# EasyEDA Pro project 电磁车系统板兼作业.eprj

# Schematic Schematic1
Create Date: 2024-03-16; Page Name: P1; Project Name: 电磁车系统板兼作业; Schematic Name: Schematic1; Update Date: 2024-04-13; Company: 嘉立创EDA; Page Size: A3; Version: V1.0
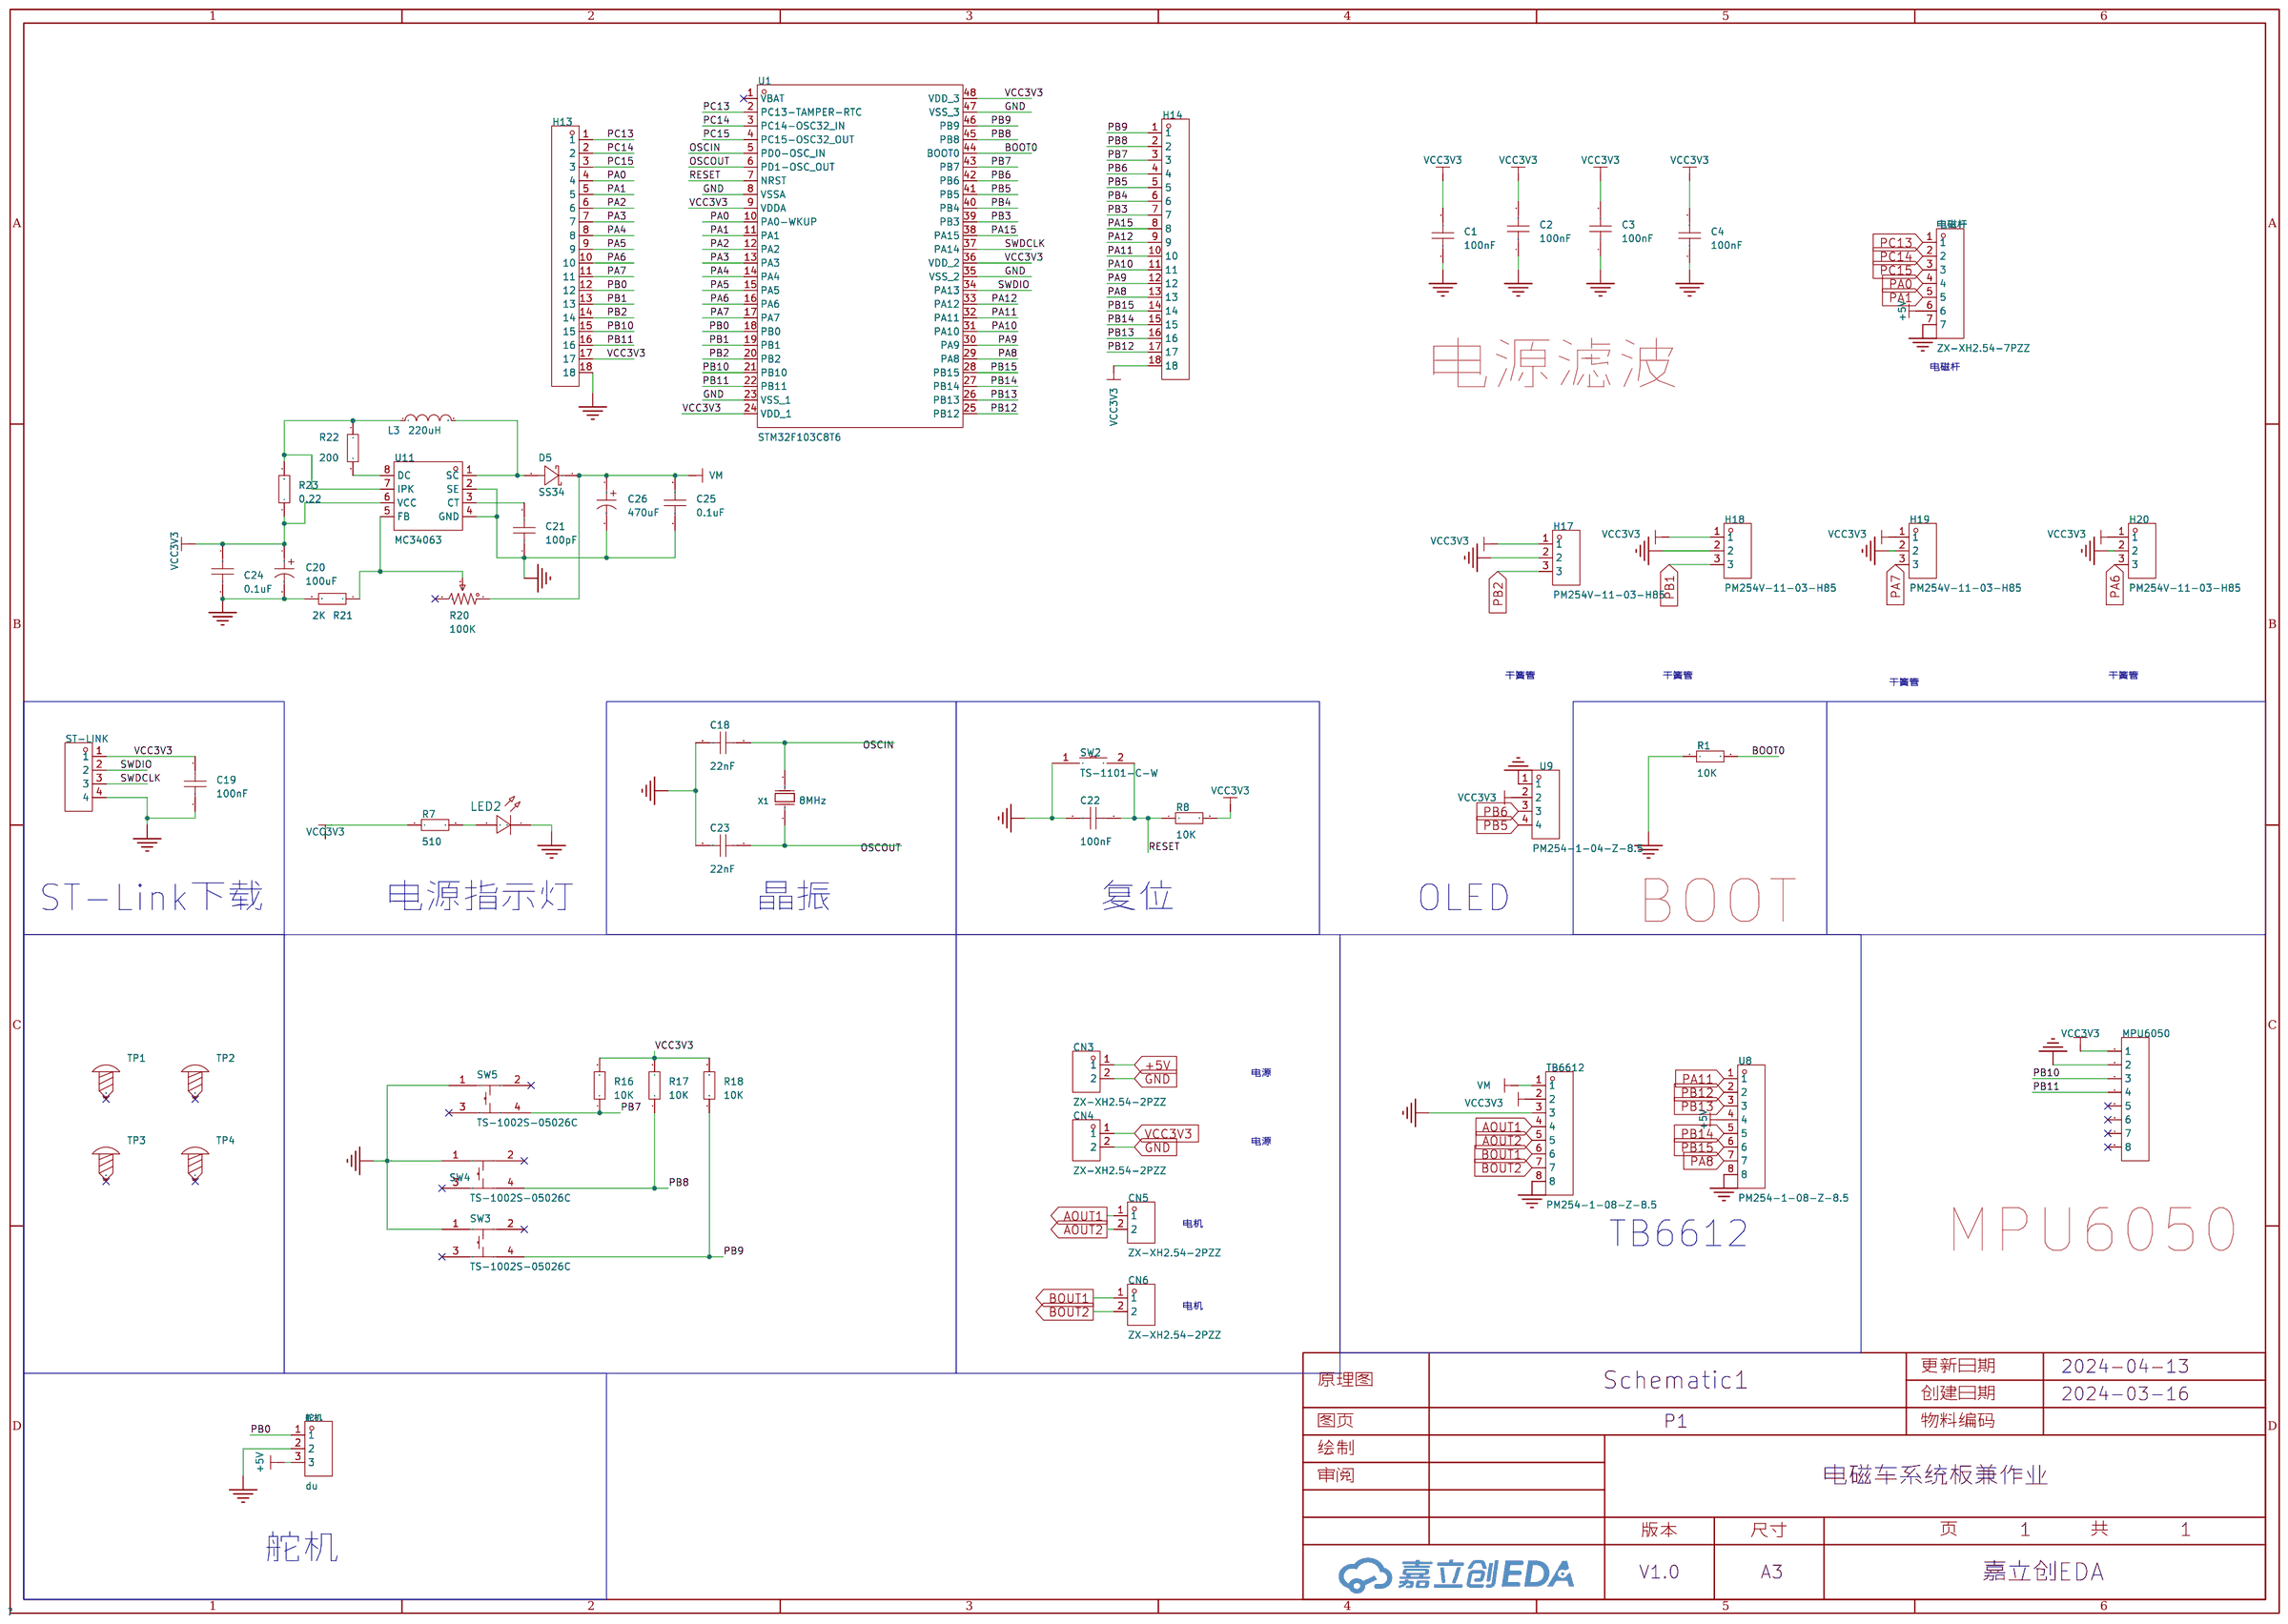
[diagram p0: schematic sheet]

## Parts
C1  100nF  [C0805]
C2  100nF  [C0805]
C3  100nF  [C0805]
C4  100nF  [C0805]
C18  22nF  [C0805]
C19  100nF  [C0603]
C20  100uF  [CAP-SMD_BD6.3-L6.6-W6.6-LS7.6-RD]
C21  100pF  [C0805]
C22  100nF  [C0603]
C23  22nF  [C0805]
C24  0.1uF  [C0805]
C25  0.1uF  [C0805]
C26  470uF  [CAP-SMD_BD6.3-L6.6-W6.6-LS7.6-RD]
CN3  ZX-XH2.54-2PZZ  [CONN-TH_2P-P2.50_HX25003-2A]
CN4  ZX-XH2.54-2PZZ  [CONN-TH_2P-P2.50_HX25003-2A]
CN5  ZX-XH2.54-2PZZ  [CONN-TH_2P-P2.50_HX25003-2A]
CN6  ZX-XH2.54-2PZZ  [CONN-TH_2P-P2.50_HX25003-2A]
D5  SS34  [SMA_L4.3-W2.5-LS5.0-RD]
H13  -  [HDR-TH_18P-P2.54-V-M]
H14  -  [HDR-TH_18P-P2.54-V-M]
H17  PM254V-11-03-H85  [HDR-TH_3P-P2.54-V-F]
H18  PM254V-11-03-H85  [HDR-TH_3P-P2.54-V-F]
H19  PM254V-11-03-H85  [HDR-TH_3P-P2.54-V-F]
H20  PM254V-11-03-H85  [HDR-TH_3P-P2.54-V-F]
L3  220uH  [ind-smd_l7.8-w7.0_scd0705n]
LED2  -  [LED_0805]
MPU6050  -  [HDR-TH_8P-P2.54-V-F-1]
R1  10K  [R0805]
R7  510  [R0805]
R8  10K  [R0805]
R16  10K  [R0805]
R17  10K  [R0805]
R18  10K  [R0805]
R20  100K  [RES-ADJ-TH_3P-L10.0-W10.0-P2.50-L]
R21  2K  [R0805]
R22  200  [R0805]
R23  0.22  [R0805]
ST-LINK  -  [HDR-TH_4P-P2.54-V-M]
SW2  TS-1101-C-W  [SW-SMD_L6.0-W3.3-LS8.0]
SW3  TS-1002S-05026C  [KEY-SMD_4P-L6.0-W6.0-P4.50-LS9.0]
SW4  TS-1002S-05026C  [KEY-SMD_4P-L6.0-W6.0-P4.50-LS9.0]
SW5  TS-1002S-05026C  [KEY-SMD_4P-L6.0-W6.0-P4.50-LS9.0]
TB6612  PM254-1-08-Z-8.5  [HDR-TH_8P-P2.54-V-F]
TP1  -  [M3螺丝]
TP2  -  [M3螺丝]
TP3  -  [M3螺丝]
TP4  -  [M3螺丝]
U1  STM32F103C8T6  [LQFP-48_L7.0-W7.0-P0.50-LS9.0-BL]
U8  PM254-1-08-Z-8.5  [HDR-TH_8P-P2.54-V-F]
U9  PM254-1-04-Z-8.5  [HDR-TH_4P-P2.54-V-F]
U11  MC34063  [SOIC-8_L5.0-W4.0-P1.27-LS6.0-BL]
X1  8MHz  [HC-49US_L11.5-W4.5-P4.88]
电磁杆  ZX-XH2.54-7PZZ  [CONN-TH_7P-P2.54_XH2.54-7P]
舵机  du  [HDR-TH_3P-P2.54-V-M]

## Library data of the parts
C1-C4 C18 C21 C23-C25 = CAP_0805: Supplier Footprint: 0805
C19 C22 = CC0603KRX7R9BB104: 容值:100nF;精度:±10%;额定电压:50V;材质(温度系数):X7R;; LCSC Part Name: 100nF ±10% 50V; Supplier Part: C14663; Manufacturer: YAGEO(国巨); Supplier Footprint: 0603; JLCPCB Part Class: 基础库; Datasheet: https://atta.szlcsc.com/upload/public/pdf/source/20180910/C282072_33301C7F631E79921B82A8DAC6BCC5B3.pdf; Supplier: LCSC; Tolerance: ±10%; Voltage Rated: 50V; Temperature Coefficient: X7R
C20 C26 = RVT1C471M0607: 容值:470uF;精度:±20%;额定电压:16V;纹波电流:185mA@120Hz;; LCSC Part Name: 470uF ±20% 16V; Supplier Part: C2977552; Manufacturer: ROQANG(容强); Supplier Footprint: SMD,D6.3xL7.7mm; JLCPCB Part Class: 扩展库; Datasheet: https://atta.szlcsc.com/upload/public/pdf/source/20220223/DD822675CC1DF2F0C06D5C2255C9C2D9.pdf; Supplier: LCSC; Tolerance: ±20%; Rated Voltage: 16V; Ripple Current: 185mA@120Hz; φD: 6.3mm; L: 7.7mm; Lifetime @ Temp: 2000hrs@105℃; Operating Temperature: -40℃~+105℃
CN3-CN6 = ZX-XH2.54-2PZZ: 插针结构:1x2P;间距:2.54mm;安装方式:直插;参考系列:XH;总PIN数:2P;排数:1;每排PIN数:2;行距:-;额定电流:3A;触头材质:黄铜;触头镀层:锡;工作温度范围:-25℃~+85℃;; Supplier Part: C7429632; Manufacturer: Megastar(兆星); Supplier Footprint: 插件,P=2.54mm; JLCPCB Part Class: 扩展库; Datasheet: https://atta.szlcsc.com/upload/public/pdf/source/20230619/19BA6947230AA44A04D3EDD65E618FD0.pdf; Supplier: LCSC; Pins Structure: 1x2P; Pitch: 2.54mm; Mounting Style: 直插; Reference Series: XH; Number of Pins: 2P; Number of Rows: 1; Number of PINs Per Row: 2; Current Rating (Max): 3A; Contact Material: 黄铜; Contact Plating: 锡; Operating Temperature Range: -25℃~+85℃
D5 = SS34_C727060: 二极管配置:独立式;正向压降(Vf):550mV@3A;直流反向耐压(Vr):40V;平均整流电流(Io):3A;; LCSC Part Name: 电压:40V 电流:3A; Supplier Part: C727060; Manufacturer: TWGMC(台湾迪嘉); Supplier Footprint: SMA(DO-214AC); JLCPCB Part Class: 扩展库; Datasheet: https://atta.szlcsc.com/upload/public/pdf/source/20200828/C727059_6599B6CAC5F3238B9C33E46794659DBE.pdf; Supplier: LCSC; Diode Configuration: 独立式; Forward Voltage (Vf@If): 550mV@3A; Reverse Voltage (Vr): 40V; Average Rectified Current (Io): 3A; Reverse Leakage Current (Ir): 500uA@40V
H13 H14 = HDR-M_2.54_1x18P: 间距:2.54mm;总PIN位数:18;排数:1;插针结构:1x18P;行距:-;安装类型:直插;圆针/方针:方针;额定电流:3A;额定电压:-;配合针长度:6mm;塑高:2.5mm;端接针长度:3mm;触头材质:-;工作温度范围:-40℃~+105℃;颜色:黑色;; Supplier Part: C2894941; Supplier Footprint: 插件
H17-H20 = PM254V-11-03-H85: 插孔结构:1x3P;间距:2.54mm;行距:-;安装类型:直插;排数:单排;总孔位数:3P;塑高:-;触头材质:黄铜;触头镀层:-;; LCSC Part Name: 间距:2.54mm 1x3P 直插; Supplier Part: C541850; Manufacturer: XFCN(兴飞); Supplier Footprint: 插件,P=2.54mm; JLCPCB Part Class: 扩展库; Datasheet: https://atta.szlcsc.com/upload/public/pdf/source/20200518/C541849_85853D71FC67C51915A806977A588FDA.pdf; Supplier: LCSC; Holes Structure: 1x3P; Pitch: 2.54mm; Mounting Type: 直插; Number of Rows: 单排; Number of Holes: 3P; Contact Material: 黄铜
L3 = SMRH74-220MT: 类型:屏蔽电感;电感值:22uH;精度:±20%;额定电流:-;饱和电流(Isat):2.1A;; LCSC Part Name: 22uH ±20% 2.1A; Supplier Part: C27442; Manufacturer: SXN(顺翔诺); Supplier Footprint: SMD; JLCPCB Part Class: 扩展库; Datasheet: https://atta.szlcsc.com/upload/public/pdf/source/20210810/BDFBFE50B8A07C1FC066F2D9473ADCAE.pdf; Supplier: LCSC; Type: 屏蔽电感; Tolerance: ±20%; Saturation Current (Isat): 2.1A; DC Resistance (DCR): 110mΩ
LED2 = LED_0805-R: Supplier Footprint: 0805
MPU6050 = HDR-F_2.54_1x8P: Supplier Part: C27438; Supplier Footprint: 插件
R1 R7 R8 R16-R18 R21-R23 = Res_0805: Supplier Footprint: 0805
R20 = 3296W-1-103: 阻值:10kΩ;精度:±10%;; LCSC Part Name: 10kΩ ±10%; Supplier Part: C118954; Manufacturer: BOCHEN(博晨); Supplier Footprint: 插件; JLCPCB Part Class: 扩展库; Datasheet: https://atta.szlcsc.com/upload/public/pdf/source/20171114/C118954_15106326646611117443.pdf; Supplier: LCSC; Tolerance: ±10%
ST-LINK = HDR-M_2.54_1x4P: Supplier Part: C492403; Supplier Footprint: 插件
SW2 = TS-1101-C-W: 触点电流:50mA;额定电压(AC):-;额定电压(DC):12V;额定功率:-;绝缘电阻:-;电路结构:单刀单掷;安装方式:立贴;带灯:无;作用力:260gf;机械寿命:5万次;带支架:否;; LCSC Part Name: 立贴 6*3.6*2.5mm 轻触开关 一型3*6*2.5有白ZD b拉伸白色带淡绿按键 卷装; Supplier Part: C318938; Manufacturer: XKB Connectivity(中国星坤); Supplier Footprint: SMD; JLCPCB Part Class: Extended Part; Datasheet: https://atta.szlcsc.com/upload/public/pdf/source/20200227/C318938_C2E53B1EEDE37D980A33616AC086DE53.pdf; Supplier: LCSC; Contact Current: 50mA; Voltage Rating (DC): 12V; Circuit: 单刀单掷; Mounting Style: 立贴; Actuator Style: 矩形按钮; Actuator/Cap Color: 白色带淡绿; With Lamp: 无; Operating Force: 260gf; Mechanical Life: 5万次; Operating Temperature: -30℃~+85℃; Switch Length: 6mm; Switch Width: 3.6mm; Switch Height: 2.5mm; Strike Gundam: 否
SW3-SW5 = TS-1002S-05026C: 电路结构:单刀单掷;触点电流:50mA;额定电压(DC):12V;安装方式:立贴;带灯:-;机械寿命:-;; LCSC Part Name: 6*6*5mm 立贴 轻触开关; Supplier Part: C455110; Manufacturer: XUNPU(讯普); Supplier Footprint: SMD,6x6mm; JLCPCB Part Class: 扩展库; Datasheet: https://atta.szlcsc.com/upload/public/pdf/source/20191118/C455126_F61E8FA1ED640FB1CE0B30B55DEB62E3.pdf; Supplier: LCSC; Circuit: 单刀单掷; Actuator Style: 圆形按钮; Switch Length: 6mm; Switch Width: 6mm; Switch Height: 5mm; Contact Current: 50mA; Voltage Rating (DC): 12V; Mounting Style: 立贴
TB6612 U8 = PM254-1-08-Z-8.5: 插孔结构:1x8P;间距:2.54mm;行距:-;圆孔/方孔:方孔;安装类型:直插;排数:单排;总孔位数:8P;额定电流:3A;额定电压:-;插孔方向:顶部;塑高:8.5mm;触头材质:铜合金;工作温度范围:-40℃~+105℃;焊接温度(最大值):260℃@5S;; LCSC Part Name: 1x8P 间距:2.54mm 直插; Supplier Part: C2897371; Manufacturer: HCTL(华灿天禄); Supplier Footprint: 插件,P=2.54mm; JLCPCB Part Class: 扩展库; Datasheet: https://atta.szlcsc.com/upload/public/pdf/source/20230609/534BE42964C679BDE98E061007C4ABD6.pdf; Supplier: LCSC; Holes Structure: 1x8P; Pitch: 2.54mm; Circular Hole / Square Hole: 方孔; Mounting Type: 直插; Number of Rows: 单排; Number of Holes: 8P; Current Rating (Max): 3A; Holes Direction: 顶部; Insulation Height: 8.5mm; Contact Material: 铜合金; Operating Temperature Range: -40℃~+105℃; Soldering Temperature(Max): 260℃@5S
TP1-TP4 = M3螺丝: Supplier Footprint: 插件
U1 = STM32F103C8T6: CPU内核:ARM Cortex-M3;CPU最大主频:72MHz;工作电压范围:2V~3.6V;程序存储容量:64KB;程序存储器类型:FLASH;RAM总容量:20KB;GPIO端口数量:37;; LCSC Part Name: STM32F103C8T6 MSL=3; Supplier Part: C8734; Manufacturer: ST(意法半导体); Supplier Footprint: LQFP-48(7x7); JLCPCB Part Class: 扩展库; Datasheet: https://atta.szlcsc.com/upload/public/pdf/source/20220812/8363ACEC51AD55ECEB84799464F7CB85.pdf; Supplier: LCSC; CPU Core: ARM Cortex-M3; CPU Maximum Speed: 72MHz; Operating Voltage Range: 2V~3.6V; Program Storage Size: 64KB; Program Memory Type: FLASH; RAM Size: 20KB; GPIO Ports Number: 37; ADC (Bit): 12bit; Universal Serial Bus: 有; Peripheral/Function: 看门狗；DMA；看门狗；片载温度传感器; Watchdog: 有; Infrared Data Association: 有; Low-Voltage Detect: 有; Direct Memory Access: 有; Internal Oscillator: 有; Operating Temperature Range: -40℃~+85℃
U9 = PM254-1-04-Z-8.5_C2897367: 插孔结构:1x4P;间距:2.54mm;行距:-;圆孔/方孔:方孔;安装类型:直插;排数:单排;总孔位数:4P;额定电流:3A;额定电压:-;插孔方向:顶部;塑高:8.5mm;触头材质:铜合金;工作温度范围:-40℃~+105℃;焊接温度(最大值):260℃@5S;; LCSC Part Name: 1x4P 间距:2.54mm 直插; Supplier Part: C2897367; Manufacturer: HCTL(华灿天禄); Supplier Footprint: 插件,P=2.54mm; JLCPCB Part Class: 扩展库; Datasheet: https://atta.szlcsc.com/upload/public/pdf/source/20230609/534BE42964C679BDE98E061007C4ABD6.pdf; Supplier: LCSC; Holes Structure: 1x4P; Pitch: 2.54mm; Circular Hole / Square Hole: 方孔; Mounting Type: 直插; Number of Rows: 单排; Number of Holes: 4P; Current Rating (Max): 3A; Holes Direction: 顶部; Insulation Height: 8.5mm; Contact Material: 铜合金; Operating Temperature Range: -40℃~+105℃; Soldering Temperature(Max): 260℃@5S
U11 = MC34063_C5349988: 功能类型:升降压型;输入电压:3V~40V;输出电压:1.25V~40V;输出电流(最大值):1.3A;输出类型:可调;; Supplier Part: C5349988; Manufacturer: HXY MOSFET(华轩阳电子); Supplier Footprint: SOP-8; JLCPCB Part Class: 扩展库; Datasheet: https://atta.szlcsc.com/upload/public/pdf/source/20230515/7BD20A1DD63BA28901BA538EC9276E37.pdf; Supplier: LCSC; Function: 升降压型; Output Type: 可调; Input Voltage: 3V~40V; Output Voltage: 1.25V~40V; Output Current (Max): 1.3A; Switching Frequency: 100kHz; Operating Temperature: 0℃~+70℃; Number of Outputs: 1; Switch tube (built-in/external): 内置
X1 = TAXD8M2GLFBET2T: 频率:8MHz;频率公差:±30ppm;负载电容:20pF;; LCSC Part Name: 8MHz ±30ppm 20pF; Supplier Part: C107425; Manufacturer: TAE(雅晶鑫); Supplier Footprint: HC-49S; JLCPCB Part Class: Extended Part; Datasheet: https://atta.szlcsc.com/upload/public/pdf/source/20170914/C127676_1505359415156967690.pdf; Supplier: LCSC; Crystal Type: 49S晶振; Frequency Tolerance: ±30ppm; Frequency Stability: ±30ppm; Load Capacitance: 20pF; Equivalent Series Resistance (ESR): 80Ω
电磁杆 = ZX-XH2.54-7PZZ: 插针结构:1x7P;间距:2.54mm;安装方式:直插;参考系列:XH;总PIN数:7P;排数:1;每排PIN数:7;行距:-;额定电流:3A;触头材质:黄铜;触头镀层:锡;工作温度范围:-25℃~+85℃;; Supplier Part: C7429637; Manufacturer: Megastar(兆星); Supplier Footprint: 插件,P=2.54mm; JLCPCB Part Class: 扩展库; Datasheet: https://atta.szlcsc.com/upload/public/pdf/source/20230619/EB8CD154C1DA3F5B1470298D84E36C50.pdf; Supplier: LCSC; Pins Structure: 1x7P; Pitch: 2.54mm; Mounting Style: 直插; Reference Series: XH; Number of Pins: 7P; Number of Rows: 1; Number of PINs Per Row: 7; Current Rating (Max): 3A; Contact Material: 黄铜; Contact Plating: 锡; Operating Temperature Range: -25℃~+85℃
舵机 = PZ254V-11-03P: 排数:单排;总PIN位数:3;间距:2.54mm;插针结构:1x3P;行距:-;安装类型:直插;圆针/方针:方针;额定电流:3A;额定电压:250V;配合针长度:6mm;塑高:2.5mm;端接针长度:3mm;工作温度范围:-40℃~+105℃;颜色:黑色;; LCSC Part Name: 2.54mm 1x3P 直插 方针; Supplier Part: C2937625; Manufacturer: XFCN(兴飞); Supplier Footprint: 直插,P=2.54mm; JLCPCB Part Class: 扩展库; Datasheet: 2022-07-12/581362A/62b9d00620994b3696be7eb4af85ad72/双排排针和单排排针.pdf; Supplier: LCSC; Number of Rows: 单排; Number of Pins: 3; Pitch: 2.54mm; Pin Structure: 1x3P; Mounting Type: 直插; Circluar Pins/Square Pins: 方针; Current Rating (Max): 3A; Voltage Rating (Max): 250V; Length of Mating Pin: 6mm; Insulation Height: 2.5mm; Length of End Connection Pin: 3mm; Operating Temperature Range: -40℃~+105℃; Color: 黑色

## Nets
+5V: CN3.1 U8.4 电磁杆.6 舵机.3
GND: C1.1 C2.1 C3.1 C4.1 C18.2 C19.1 C20.2 C21.1 C22.2 C23.2 C24.2 C25.1 C26.2 CN3.2 CN4.2 H13.18 H17.2 H18.2 H19.2 H20.2 LED2.1(C) MPU6050.2 R1.1 R21.2 ST-LINK.4 SW2.1 SW3.1 SW4.1 SW5.1 TB6612.3 TB6612.8 U1.8(VSSA) U1.23(VSS_1) U1.35(VSS_2) U1.47(VSS_3) U8.8 U9.1 U11.2(SE) U11.4(GND) 电磁杆.7 舵机.2
VCC3V3: C1.2 C2.2 C3.2 C4.2 C19.2 C20.1 C24.1 CN4.1 H13.17 H14.18 H17.1 H18.1 H19.1 H20.1 MPU6050.1 R7.1 R8.2 R16.2 R17.2 R18.2 R23.1 ST-LINK.1 TB6612.2 U1.9(VDDA) U1.24(VDD_1) U1.36(VDD_2) U1.48(VDD_3) U9.2 U11.6(VCC)
AOUT1: CN5.1 TB6612.4
AOUT2: CN5.2 TB6612.5
BOOT0: R1.2 U1.44(BOOT0)
BOUT1: CN6.1 TB6612.6
BOUT2: CN6.2 TB6612.7
OSCIN: C18.1 U1.5(PD0-OSC_IN) X1.2(OSC2)
OSCOUT: C23.1 U1.6(PD1-OSC_OUT) X1.1(OSC1)
PA0: H13.4 U1.10(PA0-WKUP) 电磁杆.4
PA1: H13.5 U1.11(PA1) 电磁杆.5
PA2: H13.6 U1.12(PA2)
PA3: H13.7 U1.13(PA3)
PA4: H13.8 U1.14(PA4)
PA5: H13.9 U1.15(PA5)
PA6: H13.10 H20.3 U1.16(PA6)
PA7: H13.11 H19.3 U1.17(PA7)
PA8: H14.13 U1.29(PA8) U8.7
PA9: H14.12 U1.30(PA9)
PA10: H14.11 U1.31(PA10)
PA11: H14.10 U1.32(PA11) U8.1
PA12: H14.9 U1.33(PA12)
PA15: H14.8 U1.38(PA15)
PB0: H13.12 U1.18(PB0) 舵机.1
PB1: H13.13 H18.3 U1.19(PB1)
PB2: H13.14 H17.3 U1.20(PB2)
PB3: H14.7 U1.39(PB3)
PB4: H14.6 U1.40(PB4)
PB5: H14.5 U1.41(PB5) U9.4
PB6: H14.4 U1.42(PB6) U9.3
PB7: H14.3 R16.1 SW5.4 U1.43(PB7)
PB8: H14.2 R17.1 SW4.4 U1.45(PB8)
PB9: H14.1 R18.1 SW3.4 U1.46(PB9)
PB10: H13.15 MPU6050.3 U1.21(PB10)
PB11: H13.16 MPU6050.4 U1.22(PB11)
PB12: H14.17 U1.25(PB12) U8.2
PB13: H14.16 U1.26(PB13) U8.3
PB14: H14.15 U1.27(PB14) U8.5
PB15: H14.14 U1.28(PB15) U8.6
PC13: H13.1 U1.2(PC13-TAMPER-RTC) 电磁杆.1
PC14: H13.2 U1.3(PC14-OSC32_IN) 电磁杆.2
PC15: H13.3 U1.4(PC15-OSC32_OUT) 电磁杆.3
RESET: C22.1 R8.1 SW2.2 U1.7(NRST)
SWDCLK: ST-LINK.3 U1.37(PA14)
SWDIO: ST-LINK.2 U1.34(PA13)
VM: C25.2 C26.1 D5.1(C) R20.1 TB6612.1
$1N2477: LED2.2(A) R7.2
$1N23263: R22.2 U11.8(DC)
$1N23266: C21.2 U11.3(CT)
$1N23268: L3.1 R22.1 R23.2 U11.7(IPK)
$1N23269: D5.2(A) L3.2 U11.1(SC)
$1N23271: R20.2 R21.1 U11.5(FB)

Not connected (* = marked no-connect by the designer): MPU6050 5* 6* 7* 8*; R20 3*; SW3 2* 3*; SW4 2* 3*; SW5 2* 3*; TP1 1*; TP2 1*; TP3 1*; TP4 1*; U1 1(VBAT)*

## Notes on the sheet
- 电磁杆
- 电源滤波
- 干簧管
- 干簧管
- 干簧管
- 干簧管
- ST-Link下载
- 电源指示灯
- 晶振
- 复位
- OLED
- BOOT
- 电源
- 电源
- 电机
- TB6612
- MPU6050
- 电机
- 舵机

# Board PCB1
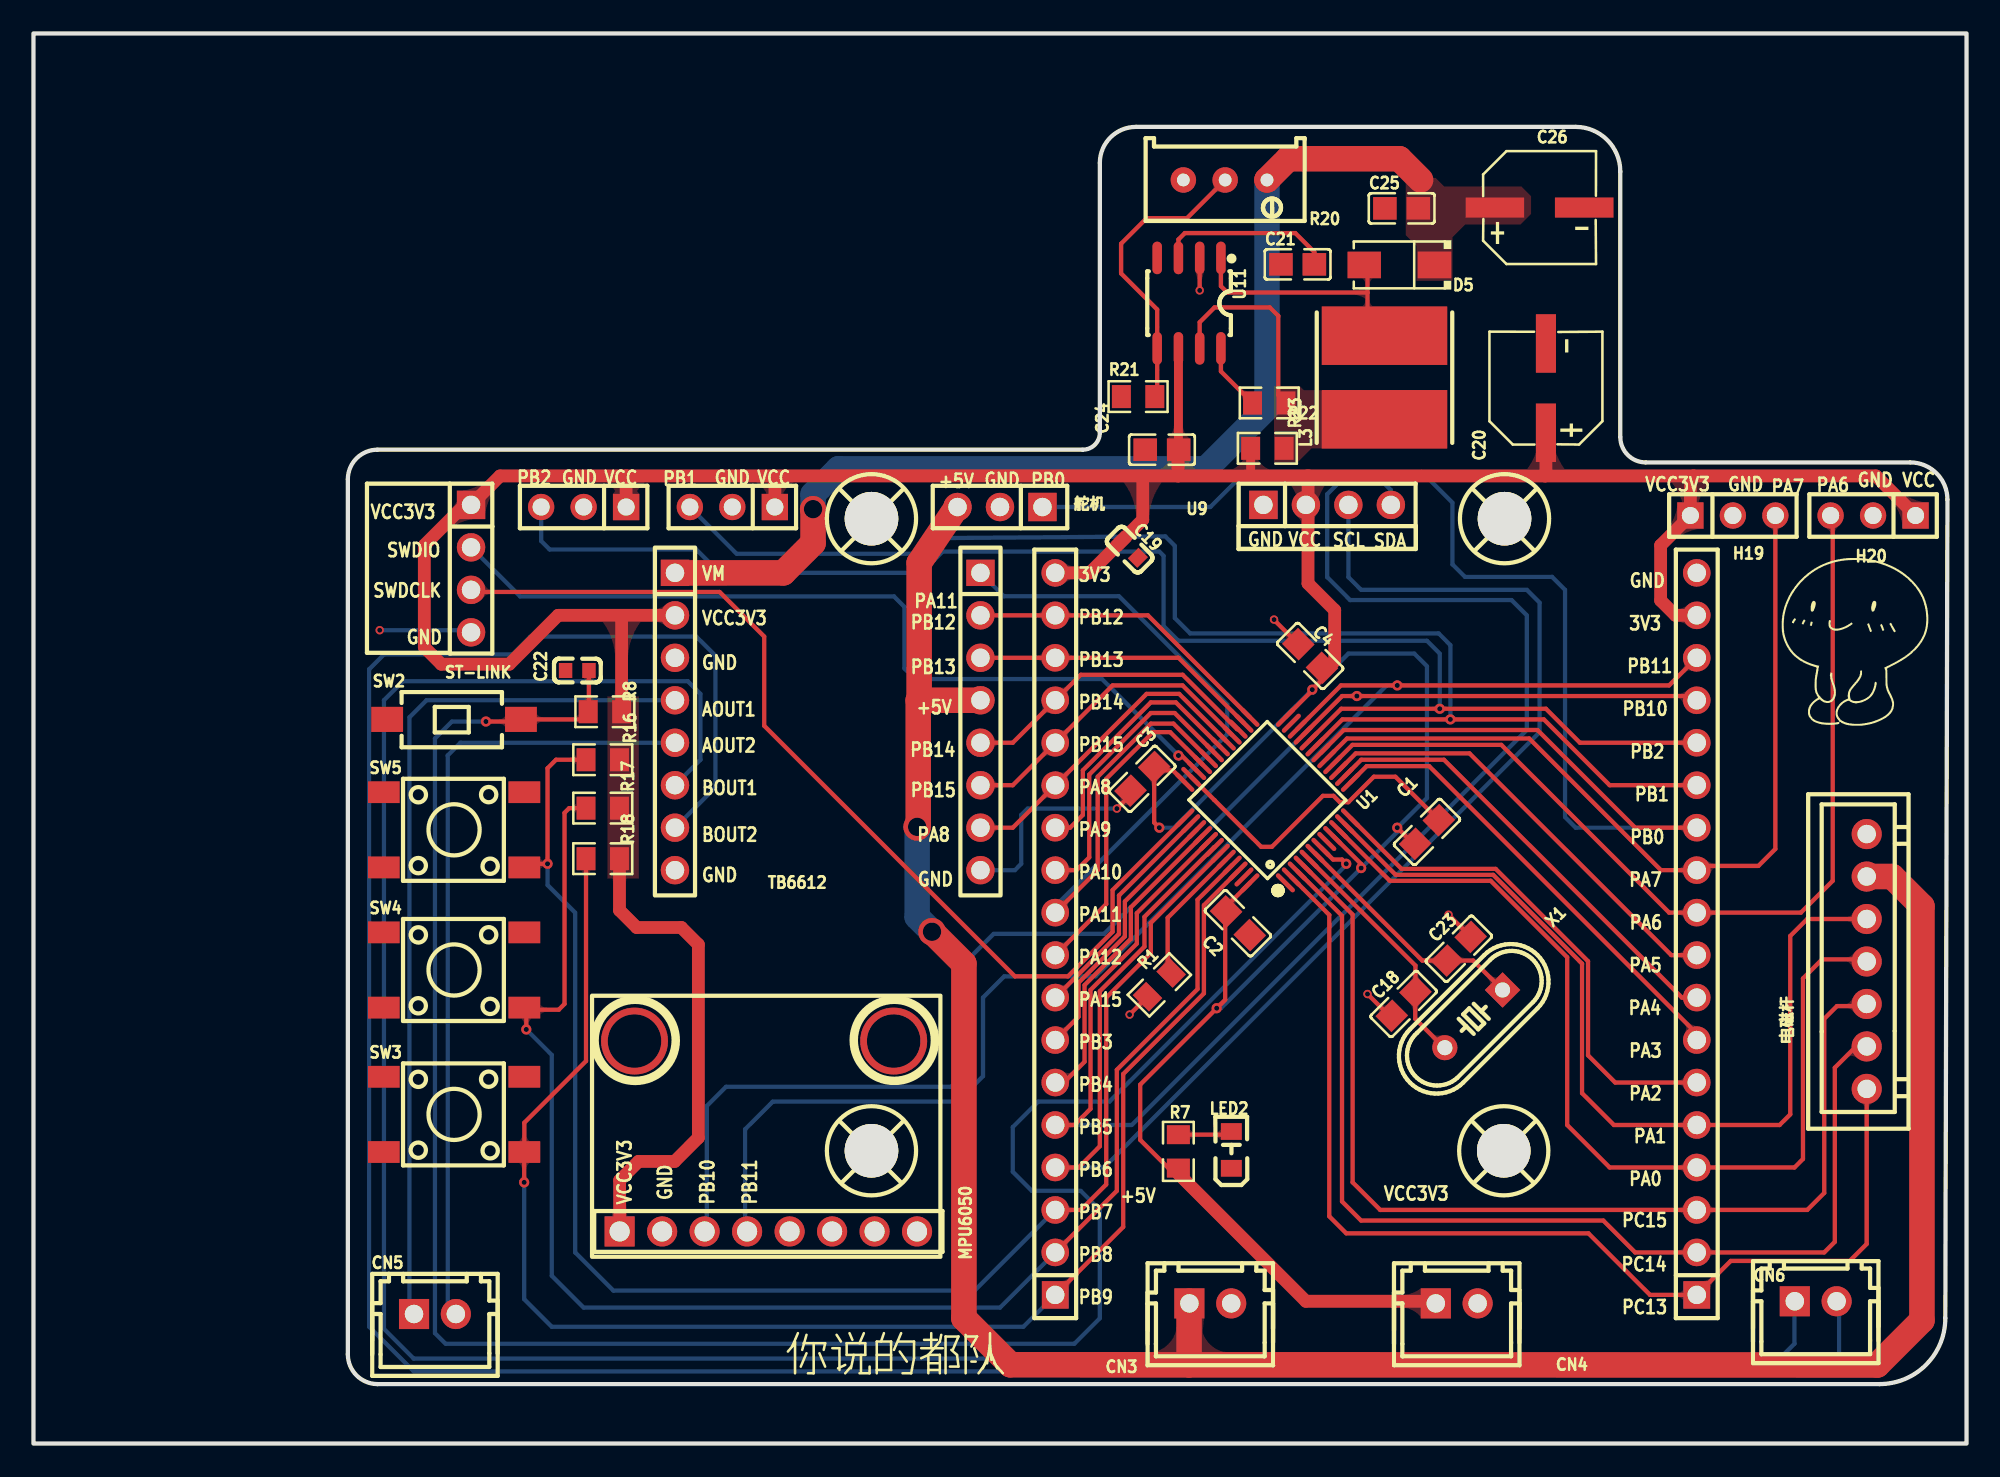
[diagram p1: board, top side]
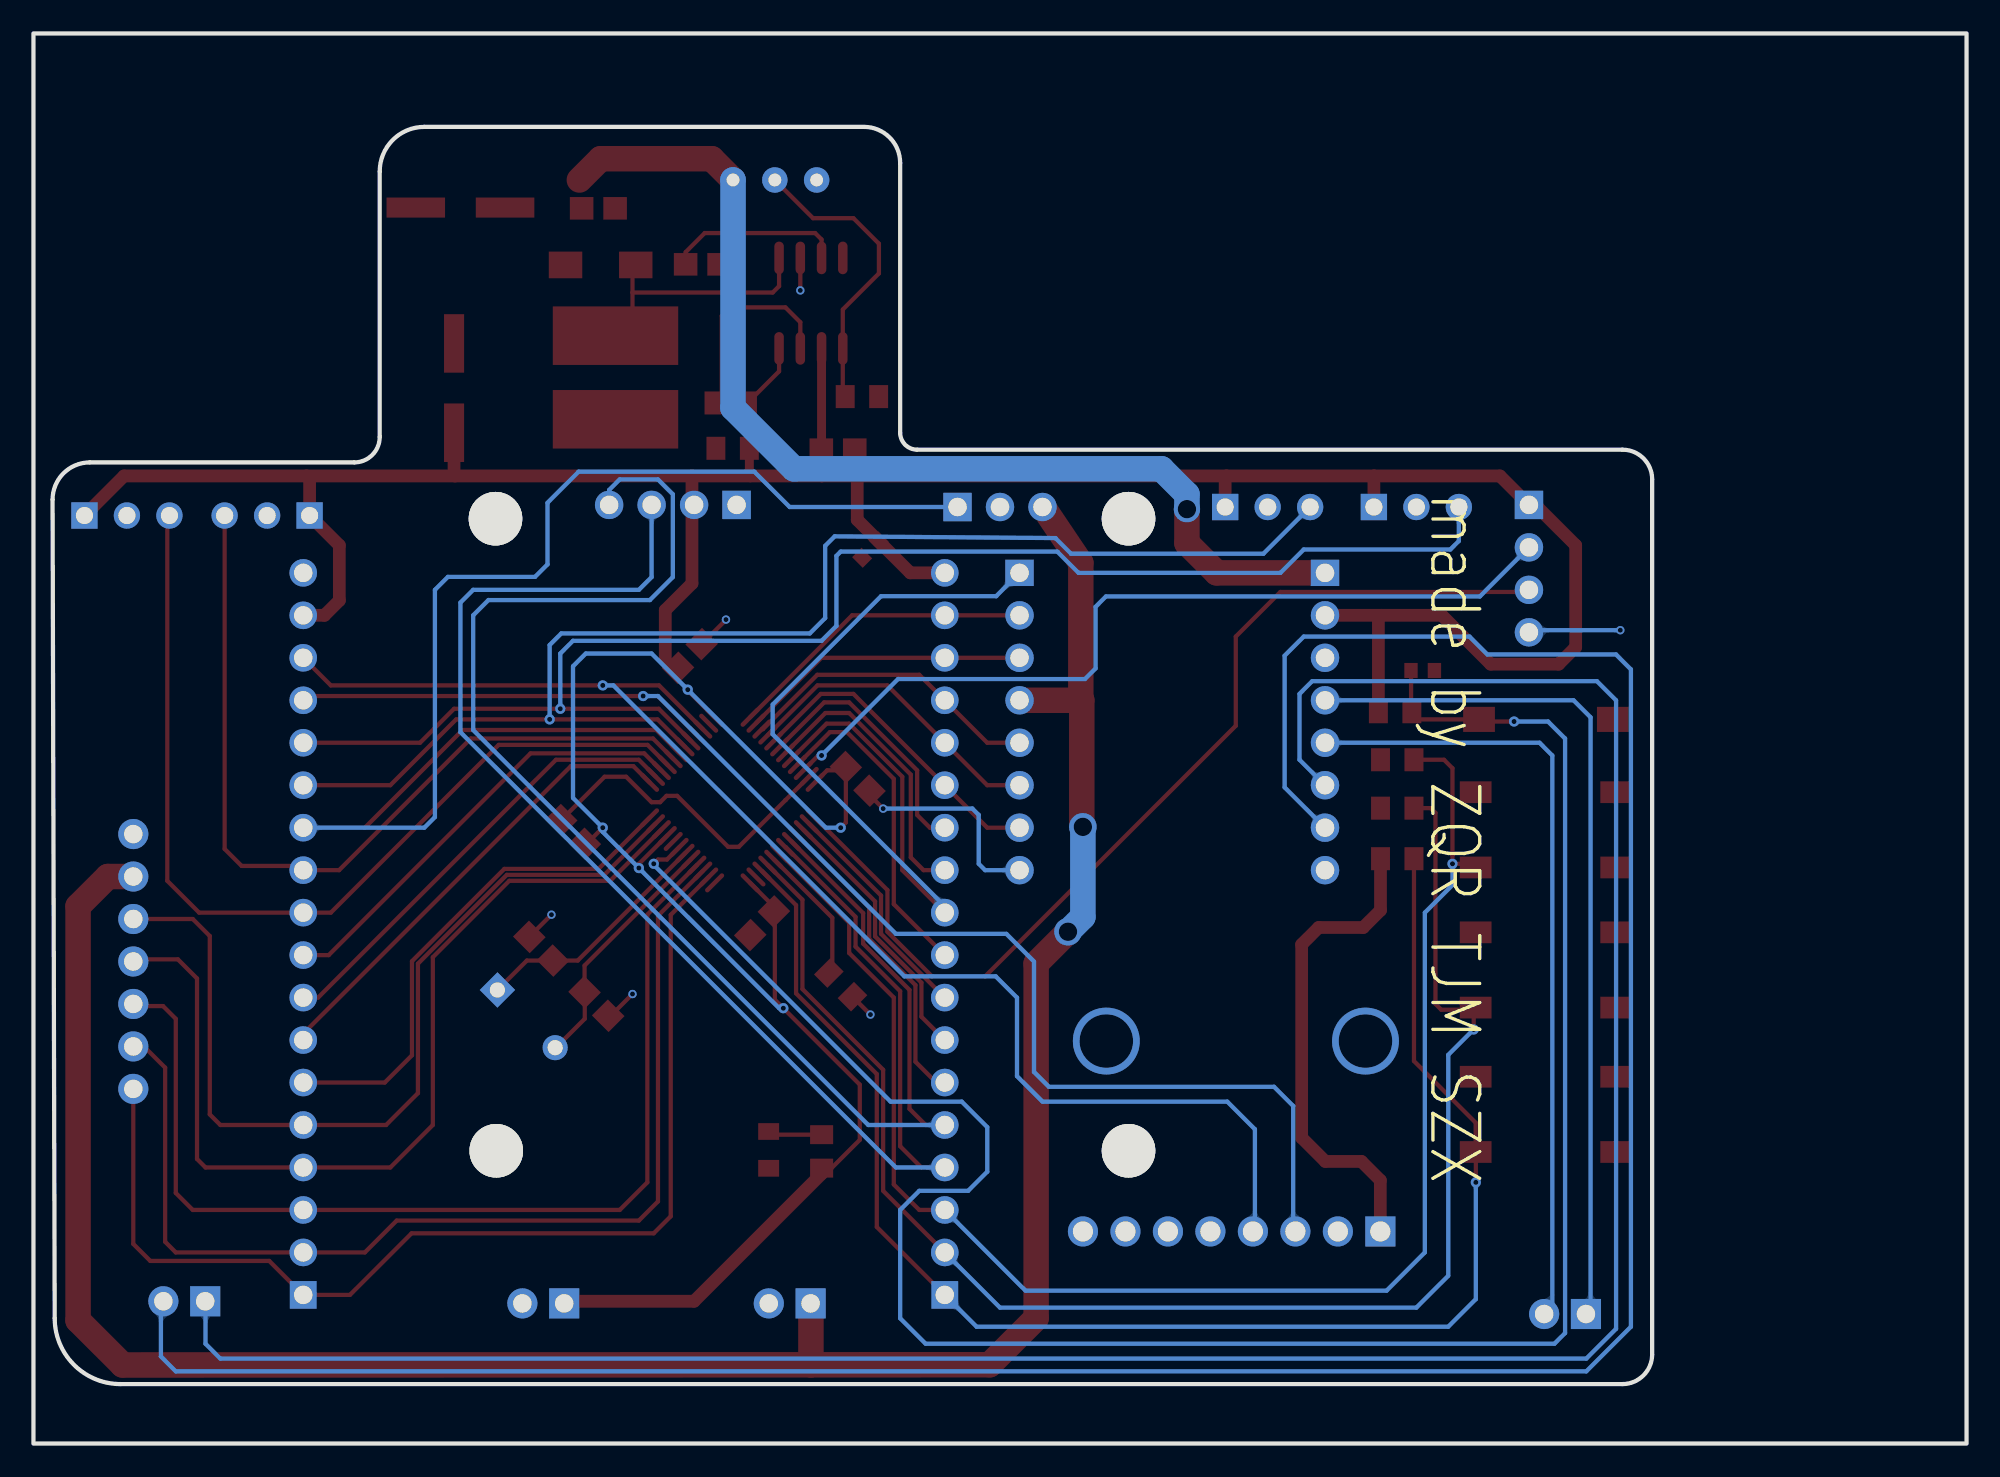
[diagram p2: board, bottom side, seen from below]

Outline 115.57 x 84.33 mm; copper layers: Top Layer, Bottom Layer. Coordinates in mm from the lower left corner of the outline.
Outline path: rectangle 0,84.33 115.57,0 ; 18.8,57.66 18.8,5.33 arc(19.32,4.08) 20.57,3.56 110.36,3.56 arc(113.15,4.71) 114.3,7.49 114.43,56.45 arc(113.78,58.02) 112.2,58.67 96.39,58.67 arc(95.32,59.12) 94.87,60.2 94.87,76.07 arc(94.09,77.96) 92.2,78.74 65.91,78.74 arc(64.39,78.11) 63.75,76.58 63.75,60.45 arc(63.46,59.73) 62.74,59.44 20.57,59.44 arc(19.32,58.92) 18.8,57.66
Stack: Top Layer 0.035mm - / Dielectric1 1.51mm FR4 er 4.5 / Bottom Layer 0.035mm -

## Design rules (mm)
template: 自定义配置
spacing copperThickness1oz (default): track to track 0.102, other pairs 0.152 to 0.3
spacing copperThickness2oz: track to track 0.203, other pairs 0.152 to 0.3
track width copperThickness1oz (default): min 0.127, default 0.254, max 2.54
track width copperThickness2oz: min 0.203, default 0.254, max 2.54
differential pair differentialPair (default): width min 0.127, default 0.254, max 2.54; gap min 0.152, default 0.152
via viaSize (default): diameter min 0.5, default 0.61, max 10; hole min 0.3, default 0.305, max 6.299

## Placement (name value [footprint] x y rotation side)
C1  100nF  [C0805]  83.31 36.58 225 top
C2  100nF  [C0805]  72.01 31.11 135 top
C3  100nF  [C0805]  66.29 39.75 45 top
C4  100nF  [C0805]  76.33 47.1 315 top
C18  22nF  [C0805]  81.92 26.29 225 top
C19  100nF  [C0603]  65.53 53.47 135 top
C20  100uF  [CAP-SMD_BD6.3-L6.6-W6.6-LS7.6-RD]  90.42 63.12 90 top
C21  100pF  [C0805]  75.58 70.52 0 top
C22  100nF  [C0603]  32.51 46.23 180 top
C23  22nF  [C0805]  85.22 29.59 45 top
C24  0.1uF  [C0805]  67.47 59.44 180 top
C25  0.1uF  [C0805]  81.8 73.87 0 top
C26  470uF  [CAP-SMD_BD6.3-L6.6-W6.6-LS7.6-RD]  90.04 73.91 0 top
CN3  ZX-XH2.54-2PZZ  [CONN-TH_2P-P2.50_HX25003-2A]  70.36 8.38 0 top
CN4  ZX-XH2.54-2PZZ  [CONN-TH_2P-P2.50_HX25003-2A]  85.09 8.38 0 top
CN5  ZX-XH2.54-2PZZ  [CONN-TH_2P-P2.50_HX25003-2A]  24 7.75 0 top
CN6  ZX-XH2.54-2PZZ  [CONN-TH_2P-P2.50_HX25003-2A]  106.55 8.51 0 top
D5  SS34  [SMA_L4.3-W2.5-LS5.0-RD]  81.66 70.48 180 top
H13  -  [HDR-TH_18P-P2.54-V-M]  99.44 30.48 90 top
H14  -  [HDR-TH_18P-P2.54-V-M]  61.09 30.48 90 top
H17  PM254V-11-03-H85  [HDR-TH_3P-P2.54-V-F]  32.89 56.01 180 top
H18  PM254V-11-03-H85  [HDR-TH_3P-P2.54-V-F]  41.78 56.01 180 top
H19  PM254V-11-03-H85  [HDR-TH_3P-P2.54-V-F]  101.6 55.5 0 top
H20  PM254V-11-03-H85  [HDR-TH_3P-P2.54-V-F]  109.98 55.5 180 top
L3  220uH  [ind-smd_l7.8-w7.0_scd0705n]  80.77 63.75 90 top
LED2  -  [LED_0805]  71.62 17.61 90 top
MPU6050  -  [HDR-TH_8P-P2.54-V-F-1]  43.94 12.68 0 top
R1  10K  [R0805]  67.31 27.43 45 top
R7  510  [R0805]  68.45 17.47 90 top
R8  10K  [R0805]  34.16 43.77 0 top
R16  10K  [R0805]  34.04 40.89 0 top
R17  10K  [R0805]  34.04 38 0 top
R18  10K  [R0805]  34.04 34.98 0 top
R20  100K  [RES-ADJ-TH_3P-L10.0-W10.0-P2.50-L]  71.25 75.56 180 top
R21  2K  [R0805]  66.04 62.61 180 top
R22  200  [R0805]  73.88 62.23 180 top
R23  0.22  [R0805]  73.77 59.52 0 top
ST-LINK  -  [HDR-TH_4P-P2.54-V-M]  26.16 52.32 270 top
SW2  TS-1101-C-W  [SW-SMD_L6.0-W3.3-LS8.0]  25.15 43.31 0 top
SW3  TS-1002S-05026C  [KEY-SMD_4P-L6.0-W6.0-P4.50-LS9.0]  25.15 19.69 0 top
SW4  TS-1002S-05026C  [KEY-SMD_4P-L6.0-W6.0-P4.50-LS9.0]  25.15 28.32 0 top
SW5  TS-1002S-05026C  [KEY-SMD_4P-L6.0-W6.0-P4.50-LS9.0]  25.15 36.7 0 top
TB6612  PM254-1-08-Z-8.5  [HDR-TH_8P-P2.54-V-F]  38.35 43.18 270 top
TP1  -  [M3螺丝]  50.17 17.45 0 top
TP2  -  [M3螺丝]  50.17 55.25 0 top
TP3  -  [M3螺丝]  87.97 17.45 0 top
TP4  -  [M3螺丝]  88.01 55.25 0 top
U1  STM32F103C8T6  [LQFP-48_L7.0-W7.0-P0.50-LS9.0-BL]  73.79 38.48 45 top
U8  PM254-1-08-Z-8.5  [HDR-TH_8P-P2.54-V-F]  56.62 43.18 270 top
U9  PM254-1-04-Z-8.5  [HDR-TH_4P-P2.54-V-F]  77.34 56.13 0 top
U11  MC34063  [SOIC-8_L5.0-W4.0-P1.27-LS6.0-BL]  69.09 68.2 180 top
X1  8MHz  [HC-49US_L11.5-W4.5-P4.88]  86.11 25.4 225 top
电磁杆  ZX-XH2.54-7PZZ  [CONN-TH_7P-P2.54_XH2.54-7P]  109.6 28.83 270 top
舵机  du  [HDR-TH_3P-P2.54-V-M]  57.78 56.01 180 top

## Footprints (pads in the part's own frame, mm; a bottom-side part is the same pattern mirrored in y, then rotated)
C0603
  rect 0.8x0.9 smd: 1(-0.7,0) 2(0.7,0)
C0805
  rect 1.41x1.35 smd: 1(-1,0) 2(1,0)
CAP-SMD_BD6.3-L6.6-W6.6-LS7.6-RD
  rect 3.5x1.2 smd: 1(-2.67,0) 2(2.67,0)
CONN-TH_2P-P2.50_HX25003-2A
  rect 1.8x1.8 hole 1.1: 1(-1.25,0)
  round 1.8 hole 1.1: 2(1.25,0)
CONN-TH_7P-P2.54_XH2.54-7P
  round 1.8 hole 1.1: 1(7.62,0) 2(5.08,0) 3(2.54,0) 4(0,0) 5(-2.54,0) 6(-5.08,0) 7(-7.62,0)
HC-49US_L11.5-W4.5-P4.88
  rect 1.5x1.5 hole 0.9: 1(-2.44,0)
  round 1.5 hole 0.9: 2(2.44,0)
HDR-TH_3P-P2.54-V-F
  rect 1.575x1.575 hole 1.02: 1(-2.54,0)
  round 1.575 hole 1.02: 2(0,0) 3(2.54,0)
HDR-TH_3P-P2.54-V-M
  rect 1.7x1.7 hole 1.1: 1(-2.54,0)
  round 1.7 hole 1.1: 2(0,0) 3(2.54,0)
HDR-TH_4P-P2.54-V-F
  rect 1.7x1.7 hole 1.1: 1(-3.81,0)
  round 1.7 hole 1.1: 2(-1.27,0) 3(1.27,0) 4(3.81,0)
HDR-TH_4P-P2.54-V-M
  rect 1.7x1.7 hole 1.1: 1(-3.81,0)
  round 1.7 hole 1.1: 2(-1.27,0) 3(1.27,0) 4(3.81,0)
HDR-TH_8P-P2.54-V-F
  rect 1.575x1.7 hole 1.1: 1(-8.89,0)
  round 1.7 hole 1.1: 2(-6.35,0) 3(-3.81,0) 4(-1.27,0) 5(1.27,0) 6(3.81,0) 7(6.35,0) 8(8.89,0)
HDR-TH_8P-P2.54-V-F-1
  rect 1.8x1.8 hole 1.2: 1(-8.89,0)
  round 1.8 hole 1.2: 2(-6.35,0) 3(-3.81,0) 4(-1.27,0) 5(1.27,0) 6(3.81,0) 7(6.35,0) 8(8.89,0)
HDR-TH_18P-P2.54-V-M
  rect 1.65x1.6 hole 1.1: 1(-21.59,0)
  round 1.65 hole 1.1: 2(-19.05,0) 3(-16.51,0) 4(-13.97,0) 5(-11.43,0) 6(-8.89,0) 7(-6.35,0) 8(-3.81,0) 9(-1.27,0) 10(1.27,0) 11(3.81,0) 12(6.35,0) 13(8.89,0) 14(11.43,0) 15(13.97,0) 16(16.51,0) 17(19.05,0) 18(21.59,0)
ind-smd_l7.8-w7.0_scd0705n
  rect 3.5x7.5 smd: 1(-2.5,0) 2(2.5,0)
KEY-SMD_4P-L6.0-W6.0-P4.50-LS9.0
  rect 1.9x1.3 smd: 1(-4.2,2.25) 2(4.2,2.25) 3(-4.2,-2.25) 4(4.2,-2.25)
LED_0805
  rect 1x1.25 smd: 1(-1.15,0.005) 2(1.05,0.005)
LQFP-48_L7.0-W7.0-P0.50-LS9.0-BL
  oval 0.27x1.5 smd: 1(-2.75,-4.25) 2(-2.25,-4.25) 3(-1.75,-4.25) 4(-1.25,-4.25) 5(-0.75,-4.25) 6(-0.25,-4.25) 7(0.25,-4.25) 8(0.75,-4.25) 9(1.25,-4.25) 10(1.75,-4.25) 11(2.25,-4.25) 12(2.75,-4.25) 25(2.75,4.25) 26(2.25,4.25) 27(1.75,4.25) 28(1.25,4.25) 29(0.75,4.25) 30(0.25,4.25) 31(-0.25,4.25) 32(-0.75,4.25) 33(-1.25,4.25) 34(-1.75,4.25) 35(-2.25,4.25) 36(-2.75,4.25)
  oval 1.5x0.27 smd: 13(4.25,-2.75) 14(4.25,-2.25) 15(4.25,-1.75) 16(4.25,-1.25) 17(4.25,-0.75) 18(4.25,-0.25) 19(4.25,0.25) 20(4.25,0.75) 21(4.25,1.25) 22(4.25,1.75) 23(4.25,2.25) 24(4.25,2.75) 37(-4.25,2.75) 38(-4.25,2.25) 39(-4.25,1.75) 40(-4.25,1.25) 41(-4.25,0.75) 42(-4.25,0.25) 43(-4.25,-0.25) 44(-4.25,-0.75) 45(-4.25,-1.25) 46(-4.25,-1.75) 47(-4.25,-2.25) 48(-4.25,-2.75)
M3螺丝
  round 3.2 hole 3.2: 1(-0.064,0.064)
R0805
  rect 1.133x1.377 smd: 1(-1,0) 2(1,0)
RES-ADJ-TH_3P-L10.0-W10.0-P2.50-L
  round 1.524 hole 0.762: 1(-2.5,0) 2(0,0) 3(2.5,0)
SMA_L4.3-W2.5-LS5.0-RD
  rect 2x1.593 smd: 1(-2.1,0) 2(2.1,0)
SOIC-8_L5.0-W4.0-P1.27-LS6.0-BL
  oval 0.569x1.95 smd: 1(-1.905,-2.705) 2(-0.635,-2.705) 3(0.635,-2.705) 4(1.905,-2.705) 5(1.905,2.705) 6(0.635,2.705) 7(-0.635,2.705) 8(-1.905,2.705)
SW-SMD_L6.0-W3.3-LS8.0
  rect 1.9x1.5 smd: 1(-4,0) 2(4,0)

## Nets
As in the schematic.

Pads without a net: MPU6050 5 6 7 8; R20 3; SW3 2 3; SW4 2 3; SW5 2 3; TP1 1; TP2 1; TP3 1; TP4 1; U1 1

## Via types
v1: diameter 4, hole 3.2, Top Layer to Bottom Layer, 2 vias
v2: diameter 0.61, hole 0.305, Top Layer to Bottom Layer, 15 vias
v3: diameter 0.5, hole 0.3, Top Layer to Bottom Layer, 5 vias
v4: diameter 0.5, hole 0.299, Top Layer to Bottom Layer, 2 vias
v5: diameter 1.65, hole 1.1, Top Layer to Bottom Layer, 2 vias
v6: diameter 1.575, hole 1.1, Top Layer to Bottom Layer, 1 via

## Routing (per net, layer and track width the routed paths; a pad name or vN(x,y) marks a point on that pad's centre or on a via; arc(x,y) is an arc through that point)
+5V: length 145.7
  Top Layer w1.524: 55.12,55.88 52.95,52.66 52.95,44.58 ; 电磁杆.6 111.12,33.91 112.9,32.13 112.9,7.37 110.24,4.7 69.09,4.71 ; 69.09,4.71 58.41,4.71 55.63,7.49 55.63,28.7 v5(53.72,30.61) ; 69.09,4.71 69.09,8.52 ; U8.4 52.9,44.45 52.9,37.08
  Bottom Layer w1.524: v5(52.83,36.88) 52.83,31.5 v5(53.72,30.61)
GND: length 47.4
  Top Layer w0.254: v3(84.6,31.63) 85.95,30.28 ; C1.1 81.42,39.88 80.14,39.88 78.61,38.35 78.11,38.35 77.72,38.73 77.09,38.73 74.04,35.69 73.4,35.69 70.61,38.48 ; v4(74.17,49.28) 74.17,49.26 C4.1 ; v4(64.77,37.97) 65.59,38.79 C3.1 ; 81.1,25.54 v3(79.76,26.88) ; 70.61,38.48 70.61,38.48 ; 70.61,38.48 U1.35 ; v3(69.72,68.96) U11.2 ; v3(65.53,25.65) R1.1
  Bottom Layer w0.254: U8.8 58.67,34.29 59.05,34.67 59.05,37.59 59.44,37.97 v4(64.77,37.97) ; v3(20.7,48.64) 26.03,48.64 ST-LINK.4
VCC3V3: length 298.1
  Top Layer w0.254: C3.2 67,37.14 v2(67.31,36.83) ; R7.1 67.86,16.47 66.17,18.16 66.17,21.46 v2(70.74,26.03) 71.25,26.54 71.25,31.82 ; C1.2 82.49,35.87 v2(81.53,36.83) ; 67.26,40.2 67.31,40.26 68.12,40.26 U1.36 ; C4.2 77.03,45.66 v2(76.45,45.08) 76.45,45.04 U1.24 ; 77.68,36.36 79.37,34.66 v2(79.37,34.42) ; 71.3,31.82 71.25,31.82 ; 71.25,31.82 71.25,32.05 U1.48
  Top Layer w0.533: C24.1 68.45,59.45 U11.6 ; R23.1 72.77,57.92 72.72,57.87
  Top Layer w0.762: R8.2 35.16,49.32 arc(35.1,49.47) 34.95,49.53 ; 34.95,49.53 31.37,49.53 28.45,46.61 24.38,46.61 23.37,47.62 23.37,53.72 25.78,56.13 ST-LINK.1 27.89,57.87 35.43,57.87 ; 34.95,49.53 TB6612.2 ; 35.43,57.87 H17.1 ; 35.43,57.87 44.24,57.87 ; 44.24,57.87 66.32,57.87 ; 44.24,57.87 44.32,57.79 44.32,56.26 44.58,56.01 ; 68.44,57.87 68.44,59.4 C24.1 ; 68.44,57.87 66.32,57.87 ; 68.44,57.87 76.2,57.87 ; 66.32,57.87 66.32,55.24 C19.2 63.14,52.07 H14.18 ; 83.95,8.51 76.07,8.51 68.45,16.13 R7.1 ; 99.25,57.87 99.06,57.68 99.06,55.5 97.28,53.72 97.28,50.42 98.17,49.53 H13.17 ; 99.25,57.87 110.15,57.87 112.52,55.5 ; 99.25,57.87 90.37,57.87 ; 76.2,57.87 76.2,51.44 77.8,49.84 77.8,46.81 77.38,46.39 C4.2 ; 76.2,57.87 90.37,57.87 ; R18.2 35.04,31.89 36.07,30.86 38.73,30.86 39.75,29.84 39.75,18.29 38.33,16.87 36.18,16.87 35.05,15.74 MPU6050.1 ; 90.37,57.87 90.42,57.92 C20.1
  Bottom Layer w0.254: v2(67.31,36.83) 68.2,36.83 v2(76.45,45.08) 78.61,47.24 82.55,47.24 83.31,46.48 83.31,38.61 v2(81.53,36.83) 81.53,36.58 v2(79.37,34.42) 70.99,26.03 v2(70.74,26.03)
(no net):
  vias: v1(35.93,24.07) v1(51.43,24.07)
AOUT1: length 51.5
  Bottom Layer w0.254: 22.48,8.25 22.48,43.43 23.49,44.45 TB6612.4
AOUT2: length 47.5
  Bottom Layer w0.254: CN5.2 24.77,8.23 24.77,41.15 25.53,41.91 TB6612.5
BOOT0: length 8.1
  Top Layer w0.254: 67.81,28.3 67.81,31.44 71.31,34.95
BOUT1: length 151.5
  Bottom Layer w0.254: TB6612.6 39.88,40.89 39.88,44.83 39.12,45.59 22.1,45.59 20.95,44.45 20.95,6.86 22.73,5.08 104.39,5.08 105.28,5.97 105.28,8.64
BOUT2: length 165.4
  Bottom Layer w0.254: 107.95,8.64 107.95,5.21 107.06,4.32 22.73,4.32 20.07,6.98 20.07,46.3 20.95,47.19 28.65,47.19 29.72,48.26 39.62,48.26 40.77,47.12 40.77,39.24 TB6612.7
OSCIN: length 14.6
  Top Layer w0.254: 76.26,34.95 82.62,28.58 C18.1 ; 82.61,26.96 82.61,25.4 84.37,23.64
OSCOUT: length 14.6
  Top Layer w0.254: X1.1 86.07,28.88 83.03,28.88 U1.6
PA0: length 57.6
  Top Layer w0.254: 电磁杆.4 109.73,28.96 106.93,28.96 105.79,27.81 105.79,17.02 105.28,16.51 H13.4 94.23,16.51 91.69,19.05 91.69,29.08 87.12,33.66 81.09,33.66 U1.10
PA1: length 54.6
  Top Layer w0.254: 电磁杆.5 106.05,31.37 105.03,30.35 105.03,19.69 104.39,19.05 H13.5 94.49,19.05 92.58,20.95 92.58,28.7 87.27,34.01 81.44,34.01 78.38,37.07
PA2: length 30.6
  Top Layer w0.254: H13.6 94.57,21.59 92.94,23.22 92.94,28.84 87.42,34.37 81.79,34.37 U1.12
PA3: length 28.1
  Top Layer w0.254: U1.13 79.71,40.51 83.44,40.51 99.44,24.51 H13.7
PA4: length 27.4
  Top Layer w0.254: U1.14 79.38,40.89 84.33,40.89 98.55,26.67 H13.8
PA5: length 26.8
  Top Layer w0.254: H13.9 97.92,29.21 85.85,41.28 79.06,41.28 U1.15
PA6: length 57.2
  Top Layer w0.254: H20.3 107.57,55.37 107.57,33.66 105.66,31.75 H13.10 97.79,31.75 87.76,41.78 78.86,41.78 77.68,40.6
PA7: length 51
  Top Layer w0.254: H19.3 104.14,35.56 103.12,34.54 99.7,34.54 H13.11 97.3,34.29 89.42,42.16 78.53,42.16 U1.17
PA8: length 19.2
  Top Layer w0.254: 71.31,42.02 68.5,44.83 66.55,44.83 H14.13 58.55,36.83 U8.7
PA9: length 15.6
  Top Layer w0.254: H14.12 61.98,36.83 62.74,37.59 62.74,40.26 66.8,44.32 68.3,44.32 70.96,41.66
PA10: length 17.3
  Top Layer w0.254: H14.11 62.36,34.29 63.12,35.05 63.12,40 66.8,43.69 68.23,43.69 U1.31
PA11: length 52.7
  Top Layer w0.254: U1.32 68.15,43.05 66.8,43.05 63.63,39.88 63.63,34.29 H14.10
  Bottom Layer w0.254: U8.1 58.01,50.67 64.9,50.67 71.37,44.2 71.37,42.42 61.09,32.13 H14.10
PA12: length 19.5
  Top Layer w0.254: H14.9 64.14,32.26 64.14,39.75 66.93,42.55 67.96,42.55 69.9,40.6
PA15: length 13.8
  Top Layer w0.254: 69.19,37.07 64.9,32.77 64.9,30.48 H14.8
PB0: length 84.7
  Top Layer w0.254: H13.12 95.76,36.83 89.92,42.67 78.33,42.67 U1.18
  Bottom Layer w0.254: H13.12 92.2,36.83 91.57,37.47 91.57,51.05 90.79,51.83 85.59,51.83 84.84,52.58 84.84,56.26 82.98,58.12 72.47,58.12 70.36,56.01 60.58,56.01 60.2,55.63
PB1: length 82.3
  Top Layer w0.254: 76.62,41.66 78.26,43.31 v2(84.71,43.31) 90.3,43.31 94.23,39.37 H13.13
  Bottom Layer w0.254: v2(84.71,43.31) 84.71,47.75 84.01,48.45 69.15,48.45 68.24,49.36 68.24,53.68 67.67,54.25 54.47,54.15 53.53,53.21 42.04,53.21 H18.3 39.24,56.52
PB2: length 90.2
  Top Layer w0.254: 76.26,42.02 78.19,43.94 v2(84.07,43.94) 90.42,43.94 92.46,41.91 H13.14
  Bottom Layer w0.254: v2(84.07,43.94) 84.07,47.24 83.31,48.01 68.45,48.01 67.56,48.89 67.56,53.09 67.31,53.34 54.36,53.34 53.09,52.07 41.02,52.07 39.62,53.47 30.86,53.47 30.35,53.97 H17.3
PB3: length 16.1
  Top Layer w0.254: H14.7 62.48,25.53 62.48,27.56 65.25,30.33 65.25,32.42 U1.39
PB4: length 18.7
  Top Layer w0.254: 69.9,36.36 65.61,32.07 65.61,30.19 62.84,27.42 62.84,22.83 61.59,21.59 H14.6
PB5: length 89.4
  Top Layer w0.254: H14.5 62.23,19.05 63.2,20.02 63.2,27.13 65.96,29.9 65.96,31.72 U1.41
  Bottom Layer w0.254: H14.5 65.66,19.05 89.28,42.67 89.28,49.53 88.37,50.44 78.71,50.44 77.34,51.82 77.34,56.77 78.23,57.66 80.52,57.66 81.15,57.02 U9.4
PB6: length 87.8
  Top Layer w0.254: H14.4 62.48,16.51 63.75,17.78 63.75,27.05 66.42,29.72 66.42,31.5 70.58,35.65 U1.42
  Bottom Layer w0.254: U9.3 78.61,51.82 79.37,51.05 89.28,51.05 90.04,50.29 90.04,42.55 64.01,16.51 H14.4
PB7: length 91.6
  Top Layer w0.254: H14.3 62.61,13.97 64.14,15.49 64.14,26.67 66.8,29.34 66.8,31.14 U1.43 ; R16.1 31.24,40.89 30.73,40.39 v2(30.73,34.67) 29.56,34.67 SW5.4
  Bottom Layer w0.254: v2(30.73,34.67) 30.73,33.4 32.38,31.75 32.38,11.43 34.67,9.14 56.26,9.14 H14.3
PB8: length 91.8
  Top Layer w0.254: R17.1 32.03,38 31.75,37.72 31.75,26.29 31.41,25.94 29.35,25.94 29.46,25.83 v2(29.46,24.77) ; U1.45 69.6,32.52 69.6,27.18 64.77,22.35 64.77,15.11 H14.2
  Bottom Layer w0.254: v2(29.46,24.77) 30.99,23.24 30.99,10.03 32.89,8.13 57.78,8.13 H14.2
PB9: length 91
  Top Layer w0.254: R18.1 33.04,22.88 29.35,19.19 SW3.4 29.34,17.43 v2(29.34,15.62) ; U1.46 69.98,32.2 69.98,26.92 65.15,22.1 65.15,12.95 H14.1
  Bottom Layer w0.254: H14.1 59.18,6.98 30.99,6.98 29.34,8.64 v2(29.34,15.62)
PB10: length 85.1
  Top Layer w0.254: H13.15 99.19,44.7 v2(79.12,44.7) 78.24,44.7 U1.21
  Bottom Layer w0.254: MPU6050.3 40.26,12.82 40.26,20.19 41.4,21.34 54.86,21.34 55.75,22.22 55.75,28.83 57.4,30.48 64.01,30.48 78.23,44.7 v2(79.12,44.7)
PB11: length 84.6
  Top Layer w0.254: H13.16 97.79,45.34 v2(81.53,45.34) 78.17,45.34 U1.22
  Bottom Layer w0.254: v2(81.53,45.34) 80.9,45.34 63.5,27.94 58.04,27.94 56.77,26.67 56.77,21.97 55.24,20.45 44.2,20.45 42.55,18.8 42.55,12.81 MPU6050.4
PB12: length 17.7
  Top Layer w0.254: 57.51,49.53 H14.17 66.63,49.53 U1.25
PB13: length 16.5
  Top Layer w0.254: 57.51,46.99 H14.16 68.46,46.99 72.37,43.08
PB14: length 18.4
  Top Layer w0.254: U8.5 58.55,41.91 H14.15 62.61,45.97 68.71,45.97 71.96,42.72 U1.27
PB15: length 18.8
  Top Layer w0.254: U8.6 58.55,39.37 H14.14 64.52,45.34 68.7,45.34 U1.28
PC13: length 65.8
  Top Layer w0.254: U1.2 77.47,31.62 77.47,13.59 78.49,12.57 92.96,12.57 96.65,8.89 H13.1 101.47,10.92 108.58,10.92 109.6,11.94 电磁杆.1
PC14: length 65.1
  Top Layer w0.254: U1.3 78.23,31.56 78.23,14.48 79.37,13.34 93.85,13.34 95.76,11.43 H13.2 107.06,11.43 107.7,12.06 107.7,22.48 109.09,23.88 109.73,23.88 电磁杆.2
PC15: length 63.1
  Top Layer w0.254: U1.4 78.87,31.63 78.87,15.62 80.52,13.97 H13.3 106.05,13.97 107.06,14.99 107.06,25.4 107.82,26.16 109.73,26.16 电磁杆.3
RESET: length 132.2
  Top Layer w0.254: v2(78.49,34.67) 78.23,34.92 77.7,34.92 U1.7 ; v2(27.05,43.18) 29.02,43.18 SW2.2 32.7,43.31 R8.1 33.21,43.81 33.21,46.23
  Bottom Layer w0.254: v2(27.05,43.18) 25.02,43.18 24,42.16 24,6.6 24.64,5.97 62.23,5.97 63.75,7.49 63.75,13.97 62.61,15.11 59.69,15.11 58.55,16.26 58.55,18.92 60.07,20.45 64.32,20.45 78.49,34.61 v2(78.49,34.67)
SWDCLK: length 60.8
  Top Layer w0.254: ST-LINK.3 26.29,50.93 41.02,50.93 43.69,48.26 43.69,42.93 58.67,27.94 61.85,27.94 64.52,30.61 64.52,33.1 U1.37
SWDIO: length 51.1
  Top Layer w0.254: v2(68.45,41.15) 68.64,41.15 U1.34
  Bottom Layer w0.254: v2(68.45,41.15) 63.88,45.72 52.7,45.72 52.07,46.36 52.07,50.04 51.45,50.66 29.1,50.66 ST-LINK.2
VM: length 65.1
  Top Layer w1.524: 82.93,75.56 81.66,76.83 75.02,76.83 R20.1 ; TB6612.1 44.83,52.07 46.61,53.85 v6(46.61,55.88)
  Bottom Layer w1.524: R20.1 73.75,61.94 70.1,58.29 48.13,58.29 46.61,56.77 v6(46.61,55.88)
$1N2477: length 3.2
  Top Layer w0.254: LED2.2 71.43,18.47 R7.2
$1N23263: length 4
  Top Layer w0.254: R22.2 70.99,64.12 U11.8
$1N23266: length 10.6
  Top Layer w0.254: C21.2 76.58,71.25 75.44,72.39 68.84,72.39 68.45,72.01 U11.3
$1N23268: length 12.2
  Top Layer w0.254: U11.7 69.72,67.06 70.61,67.94 73.91,67.94 74.42,67.44 74.42,62.69 R22.1
$1N23269: length 15.5
  Top Layer w0.254: 79.76,68.83 79.76,69.85 79.37,70.23 79.37,70.3 D5.2 ; 79.76,68.83 79.76,67.27 L3.2 ; 79.76,68.83 71.37,68.83 70.99,69.22 U11.1
$1N23271: length 17.9
  Top Layer w0.254: R20.2 68.96,73.28 66.55,73.28 65.02,71.75 65.02,69.98 67.18,67.82 U11.5 67.18,62.79 67.02,62.63

## Copper pours and planes (outline as drawn; the poured copper is in the pictures)
GND on Bottom Layer: 5.84,89.41 129.54,89.41 129.54,5.97 5.84,5.97
VCC3V3 on Top Layer: 34.31,44.68 36.2,44.68 36.2,33.78 34.31,33.78
VM on Top Layer: 82.04,75.69 89.53,75.69 89.53,69.53 82.04,69.53
$1N23268 on Top Layer: 74.17,63.25 84.51,63.25 84.51,58.6 74.17,58.6

Small or netless copper shapes (teardrops, artwork), in the pictures only: 208 on Top Layer, 45 on Bottom Layer

## Text on the board
Bottom Silkscreen Layer: made by ZQR TJM SZX
Top Silkscreen Layer: PB0 | 3V3 | PB12 | PB13 | PB14 | PB15 | PA8 | PA9 | PA10 | PA11 | PA12 | PA15 | PB3 | PB4 | PB5 | PB6 | PB7 | PB8 | PB9 | GND | VCC | SCL | SDA | PC14 | PC15 | PC13 | PB10 | PB11 | PA4 | PA7 | PA5 | PA3 | PA2 | PA0 | PA6 | PB2 | PA1 | PB1 | VM | VCC3V3 | AOUT1 | AOUT2 | BOUT1 | BOUT2 | +5V | SWDIO | SWDCLK | 你说的都队
